# Altium project PCA9539.PrjPcb
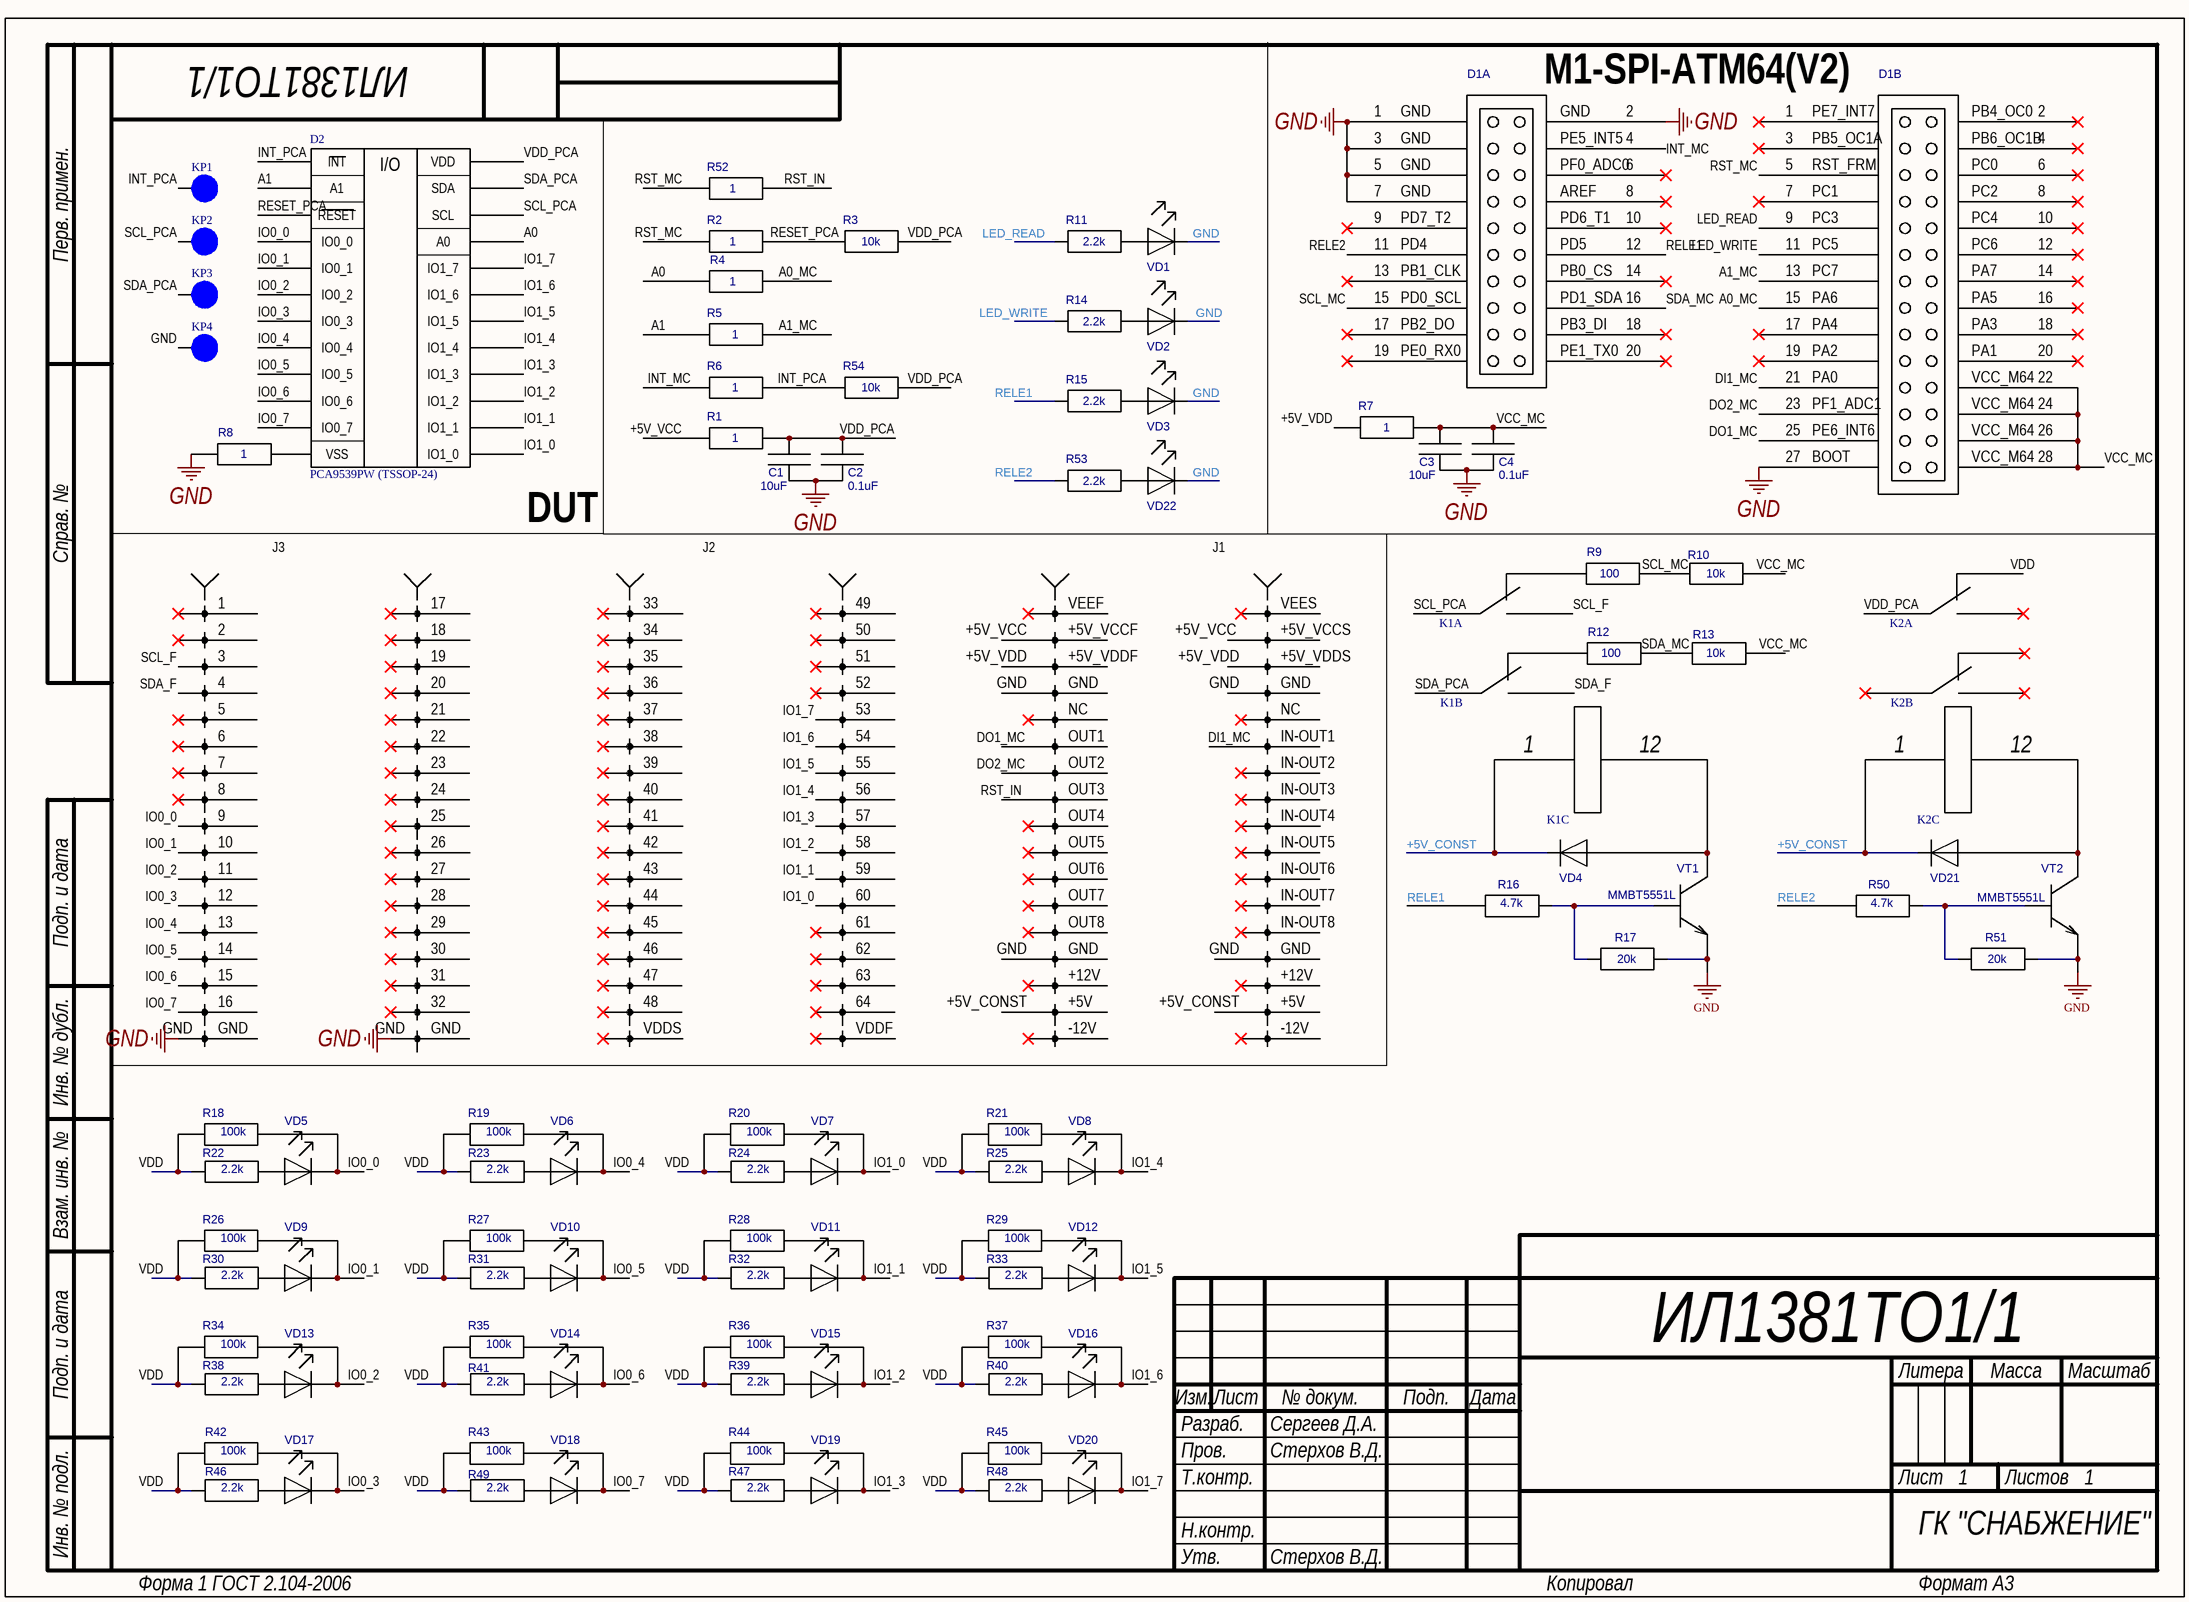
[diagram p0: Sheet1.SchDoc]
1 sheet, 91 parts. Net scope: global (net labels, ports and power ports of the same name join across sheets).
Board file: PCB1.PcbDoc

## Sheet Sheet1.SchDoc
size 410 x 297 mm; ApprovedBy: Стерхов В.Д.; CheckedBy: Стерхов В.Д.; Author: Сергеев Д.А.; CompanyName: ГК "СНАБЖЕНИЕ"; DrawnBy: Сергеев Д.А.; Engineer: Сергеев Д.А.; Organization: ГК "СНАБЖЕНИЕ"; DocumentNumber: ИЛ1381ТО1/1; SheetNumber: 1; SheetTotal: 1

### Parts
C1  10uF  [0805]
C2  0.1uF  [0805]
C3  10uF  [0805]
C4  0.1uF  [0805]
D1  M1-SPI-ATM64(V2)  [M1-SPI-ATM64(V2)]  (value not drawn)  (parts A,B of 2)
D2  PCA9539PW (TSSOP-24)  [PCA9539 (TSSSOP-24 ZIF)]
K1  V23079A1001B301 TE  [V23079A1001B301]  (value not drawn)  (parts A,B,C of 3)
K2  V23079A1001B301 TE  [V23079A1001B301]  (value not drawn)  (parts A,B,C of 3)
KP1  Contact  [Contact]  (value not drawn)
KP2  Contact  [Contact]  (value not drawn)
KP3  Contact  [Contact]  (value not drawn)
KP4  Contact  [Contact]  (value not drawn)
R1  1  [0805]
R2  1  [0805]
R3  10k  [0805]
R4  1  [0805]
R5  1  [0805]
R6  1  [0805]
R7  1  [0805]
R8  1  [0805]
R9  100  [0805]
R10  10k  [0805]
R11  2.2k  [0805]
R12  100  [0805]
R13  10k  [0805]
R14  2.2k  [0805]
R15  2.2k  [0805]
R16  4.7k  [0805]
R17  20k  [0805]
R18  100k  [0805]
R19  100k  [0805]
R20  100k  [0805]
R21  100k  [0805]
R22  2.2k  [0805]
R23  2.2k  [0805]
R24  2.2k  [0805]
R25  2.2k  [0805]
R26  100k  [0805]
R27  100k  [0805]
R28  100k  [0805]
R29  100k  [0805]
R30  2.2k  [0805]
R31  2.2k  [0805]
R32  2.2k  [0805]
R33  2.2k  [0805]
R34  100k  [0805]
R35  100k  [0805]
R36  100k  [0805]
R37  100k  [0805]
R38  2.2k  [0805]
R39  2.2k  [0805]
R40  2.2k  [0805]
R41  2.2k  [0805]
R42  100k  [0805]
R43  100k  [0805]
R44  100k  [0805]
R45  100k  [0805]
R46  2.2k  [0805]
R47  2.2k  [0805]
R48  2.2k  [0805]
R49  2.2k  [0805]
R50  4.7k  [0805]
R51  20k  [0805]
R52  1  [0805]
R53  2.2k  [0805]
R54  10k  [0805]
VD1  LED(0805)  [0805(LED)]  (value not drawn)
VD2  LED(0805)  [0805(LED)]  (value not drawn)
VD3  LED(0805)  [0805(LED)]  (value not drawn)
VD4  LL4148 NXP  [SOD80C]  (value not drawn)
VD5  LED(0805)  [0805(LED)]  (value not drawn)
VD6  LED(0805)  [0805(LED)]  (value not drawn)
VD7  LED(0805)  [0805(LED)]  (value not drawn)
VD8  LED(0805)  [0805(LED)]  (value not drawn)
VD9  LED(0805)  [0805(LED)]  (value not drawn)
VD10  LED(0805)  [0805(LED)]  (value not drawn)
VD11  LED(0805)  [0805(LED)]  (value not drawn)
VD12  LED(0805)  [0805(LED)]  (value not drawn)
VD13  LED(0805)  [0805(LED)]  (value not drawn)
VD14  LED(0805)  [0805(LED)]  (value not drawn)
VD15  LED(0805)  [0805(LED)]  (value not drawn)
VD16  LED(0805)  [0805(LED)]  (value not drawn)
VD17  LED(0805)  [0805(LED)]  (value not drawn)
VD18  LED(0805)  [0805(LED)]  (value not drawn)
VD19  LED(0805)  [0805(LED)]  (value not drawn)
VD20  LED(0805)  [0805(LED)]  (value not drawn)
VD21  LL4148 NXP  [SOD80C]  (value not drawn)
VD22  LED(0805)  [0805(LED)]  (value not drawn)
VT1  MMBT5551L  [SOT-23]
VT2  MMBT5551L  [SOT-23]
X1  FORMULA  [FORMULA]  (value not drawn)

### Nets
GND: C1.2 C2.2 C3.2 C4.2 D1.1X2 D1.2X2 D1.3X2 D1.5X2 D1.7X2 D1.27X3 KP4.1 R8.1 R17.2 R51.2 VD1.2(K) VD2.2(K) VD3.2(K) VD22.2(K) VT1.2(E) VT2.2(E) X1.GND
+5V_CONST: K1.1 K2.1 VD4.2(K) VD21.2(K) X1.+5V
+5V_VCC: R1.1 X1.+5V_VCCF(VCCF) X1.+5V_VCCS(VCCS)
+5V_VDD: R7.1 X1.+5V_VDDF(VDDF) X1.+5V_VDDS(VDDS)
A0: D2.21 R4.1
A0_MC: D1.15X3 R4.2
A1: D2.2 R5.1
A1_MC: D1.13X3 R5.2
DI1_MC: D1.21X3 X1.IN-OUT1
DO1_MC: D1.25X3 X1.OUT1
DO2_MC: D1.23X3 X1.OUT2
INT_MC: D1.4X2 R6.1
INT_PCA: D2.1 KP1.1 R6.2 R54.1
IO0_0: D2.4 R18.2 VD5.2(K) X1.9
IO0_1: D2.5 R26.2 VD9.2(K) X1.10
IO0_2: D2.6 R34.2 VD13.2(K) X1.11
IO0_3: D2.7 R42.2 VD17.2(K) X1.12
IO0_4: D2.8 R19.2 VD6.2(K) X1.13
IO0_5: D2.9 R27.2 VD10.2(K) X1.14
IO0_6: D2.10 R35.2 VD14.2(K) X1.15
IO0_7: D2.11 R43.2 VD18.2(K) X1.16
IO1_0: D2.13 R20.2 VD7.2(K) X1.60
IO1_1: D2.14 R28.2 VD11.2(K) X1.59
IO1_2: D2.15 R36.2 VD15.2(K) X1.58
IO1_3: D2.16 R44.2 VD19.2(K) X1.57
IO1_4: D2.17 R21.2 VD8.2(K) X1.56
IO1_5: D2.18 R29.2 VD12.2(K) X1.55
IO1_6: D2.19 R37.2 VD16.2(K) X1.54
IO1_7: D2.20 R45.2 VD20.2(K) X1.53
LED_READ: D1.9X3 R11.1
LED_WRITE: D1.11X3 R14.1
RELE1: D1.12X2 R15.1 R16.1
RELE2: D1.11X2 R50.1 R53.1
RESET_PCA: D2.3 R2.2 R3.1
RST_IN: R52.2 X1.OUT3
RST_MC: D1.5X3 R2.1 R52.1
SCL_F: K1.5 X1.3
SCL_MC: D1.15X2 R9.2 R10.1
SCL_PCA: D2.22 K1.4 KP2.1
SDA_F: K1.8 X1.4
SDA_MC: D1.16X2 R12.2 R13.1
SDA_PCA: D2.23 K1.9 KP3.1
VCC_MC: C3.1 C4.1 D1.22X3 D1.24X3 D1.26X3 D1.28X3 R7.2 R10.2 R13.2
VDD: K2.3 R18.1 R19.1 R20.1 R21.1 R22.1 R23.1 R24.1 R25.1 R26.1 R27.1 R28.1 R29.1 R30.1 R31.1 R32.1 R33.1 R34.1 R35.1 R36.1 R37.1 R38.1 R39.1 R40.1 R41.1 R42.1 R43.1 R44.1 R45.1 R46.1 R47.1 R48.1 R49.1
VDD_PCA: C1.1 C2.1 D2.24 K2.4 R1.2 R3.2 R54.2
NetD2_12: D2.12 R8.2
NetK1_3: K1.3 R9.1
NetK1_10: K1.10 R12.1
NetK1_12: K1.12 VD4.1(A) VT1.3(K)
NetK2_12: K2.12 VD21.1(A) VT2.3(K)
NetR11_2: R11.2 VD1.1(A)
NetR14_2: R14.2 VD2.1(A)
NetR15_2: R15.2 VD3.1(A)
NetR16_2: R16.2 R17.1 VT1.1(B)
NetR22_2: R22.2 VD5.1(A)
NetR23_2: R23.2 VD6.1(A)
NetR24_2: R24.2 VD7.1(A)
NetR25_2: R25.2 VD8.1(A)
NetR30_2: R30.2 VD9.1(A)
NetR31_2: R31.2 VD10.1(A)
NetR32_2: R32.2 VD11.1(A)
NetR33_2: R33.2 VD12.1(A)
NetR38_2: R38.2 VD13.1(A)
NetR39_2: R39.2 VD15.1(A)
NetR40_2: R40.2 VD16.1(A)
NetR41_2: R41.2 VD14.1(A)
NetR46_2: R46.2 VD17.1(A)
NetR47_2: R47.2 VD19.1(A)
NetR48_2: R48.2 VD20.1(A)
NetR49_2: R49.2 VD18.1(A)
NetR50_2: R50.2 R51.1 VT2.1(B)
NetR53_2: R53.2 VD22.1(A)

Not connected (* = marked no-connect by the designer): D1 1X3* 2X3* 3X3* 4X3* 6X2* 6X3* 7X3* 8X2* 8X3* 9X2* 10X2* 10X3* 12X3* 13X2* 14X2* 14X3* 16X3* 17X2* 17X3* 18X2* 18X3* 19X2* 19X3* 20X2* 20X3*; K2 5* 8* 9* 10*; X1 1* 2* 5* 6* 7* 8* 17* 18* 19* 20* 21* 22* 23* 24* 25* 26* 27* 28* 29* 30* 31* 32* 33* 34* 35* 36(4)* 37(5)* 38* 39* 40* 41* 42* 43* 44* 45* 46* 47* 48* 49* 50* 51* 52* 61* 62* 63* 64* +12V* -12V* IN-OUT2* IN-OUT3* IN-OUT4* IN-OUT5* IN-OUT6* IN-OUT7* IN-OUT8* NC* OUT4* OUT5* OUT6* OUT7* OUT8* VDDF* VDDS* VEEF* VEES*

### Notes on the sheet
- (near D1) M1-SPI-ATM64(V2)
- DUT
- Перв. примен.
- Справ. №
- Подп. и дата
- Инв. № дубл.
- Взам. инв. №
- Разраб.
- Изм.
- Лист
- № докум.
- Подп.
- Дата
- Литера
- Масса
- Масштаб
- Пров.
- Т.контр.
- Листов
- Инв. № подл.
- Н.контр.
- Утв.
- Форма 1 ГОСТ 2.104-2006
- Копировал
- Формат А3

### Library data of the parts
C1-C4 = C0805: ComponentHeigt: 1.3; Firme: AVX; Leadform: SMD; KIND: Конденсатор; ClassName: *; Component Link: *; ComponentWeigt: *; Packaging: 0805; NN: *; Value: *
D1 = M1-SPI-ATM64(V2): ComponentHeigt: 5.5; Name: Вилка; Specification: Вилка PLD2-2 *; Typ: PLD2-2; ClassName: *; Component Link: *; ComponentWeigt: *; Firme: *; Leadform: *; NN: *; KIND: *
D2 = PCA9539PW
R1-R54 = R0805 Yageo: ComponentHeigt: 0.6; Firme: Yageo; Leadform: SMD; Kind: Резистор; ClassName: *; ComponentWeigt: *; Component Link: *; Packaging: 0805; NN: *; Value: *
VD1-VD3 VD5-VD20 VD22 = LED(0805): ComponentHeigt: 0.75; Leadform: в отверстия; Firme: Kingbright; NN: 24003000; KIND: Светодиод L-1154GD Kingbright; Component Link: *; ClassName: *
VD4 VD21 = LL4148 NXP: ComponentHeigt: 1.6; Leadform: SMD; NN: 24009301; KIND: Диод LL4148 NXP; Component Link: http://www.nxp.com; Packaging: SOD-80C; ClassName: *; Firme: NXP
VT1 VT2 = MMBT5551L: ComponentHeigt: 1.1; Firme: ONS; Leadform: SMD; NN: 24007468; KIND: Транзистор MMBT5551L*G ONS; ClassName: *; ComponentWeigt: *; Packaging: SOT-23